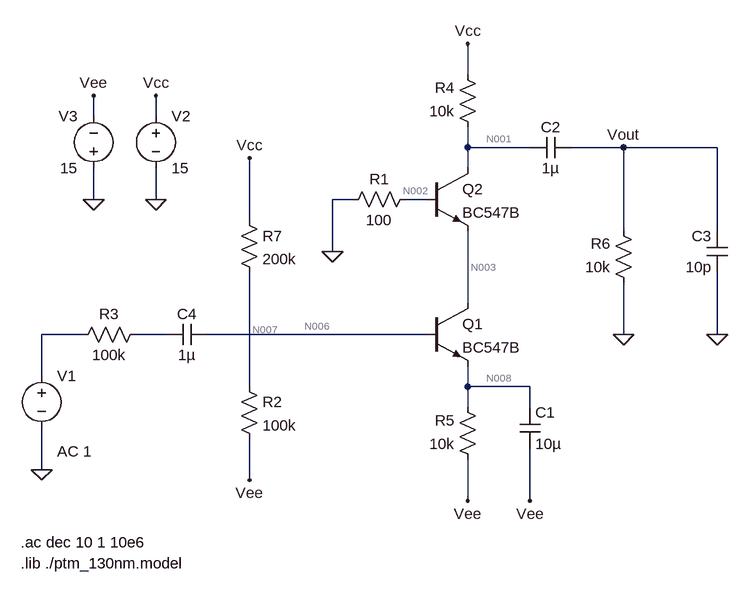
[diagram p0: schematic Draft2.asc]
Draft2.asc, the LTspice schematic file:
Version 4
SHEET 1 1020 680
WIRE 464 -224 464 -272
WIRE -112 -160 -112 -192
WIRE -16 -160 -16 -192
WIRE 464 -112 464 -144
WIRE 560 -112 464 -112
WIRE 704 -112 624 -112
WIRE 848 -112 704 -112
WIRE 464 -80 464 -112
WIRE -112 -32 -112 -80
WIRE -16 -32 -16 -80
WIRE 288 -32 256 -32
WIRE 400 -32 368 -32
WIRE 128 0 128 -96
WIRE 704 16 704 -112
WIRE 848 16 848 -112
WIRE 256 48 256 -32
WIRE 464 128 464 16
WIRE -128 176 -192 176
WIRE 0 176 -48 176
WIRE 400 176 64 176
WIRE 704 176 704 96
WIRE 848 176 848 80
WIRE -192 240 -192 176
WIRE 128 256 128 80
WIRE 464 256 464 224
WIRE 560 256 464 256
WIRE 464 288 464 256
WIRE 560 288 560 256
WIRE -192 384 -192 320
WIRE 128 400 128 336
WIRE 464 432 464 368
WIRE 560 432 560 352
FLAG 704 176 0
FLAG 848 176 0
FLAG 464 432 Vee
FLAG 560 432 Vee
FLAG 128 400 Vee
FLAG 464 -272 Vcc
FLAG -16 -32 0
FLAG -112 -32 0
FLAG -16 -192 Vcc
FLAG -112 -192 Vee
FLAG -192 384 0
FLAG 704 -112 Vout
FLAG 256 48 0
FLAG 128 -96 Vcc
SYMBOL res 384 -48 R90
WINDOW 0 0 56 VBottom 2
WINDOW 3 32 56 VTop 2
SYMATTR InstName R1
SYMATTR Value 100
SYMBOL res 112 240 R0
SYMATTR InstName R2
SYMATTR Value 100k
SYMBOL res -32 160 R90
WINDOW 0 0 56 VBottom 2
WINDOW 3 32 56 VTop 2
SYMATTR InstName R3
SYMATTR Value 100k
SYMBOL res 480 -128 R180
WINDOW 0 36 76 Left 2
WINDOW 3 36 40 Left 2
SYMATTR InstName R4
SYMATTR Value 10k
SYMBOL res 480 384 R180
WINDOW 0 36 76 Left 2
WINDOW 3 36 40 Left 2
SYMATTR InstName R5
SYMATTR Value 10k
SYMBOL res 720 112 R180
WINDOW 0 36 76 Left 2
WINDOW 3 36 40 Left 2
SYMATTR InstName R6
SYMATTR Value 10k
SYMBOL cap 544 288 R0
SYMATTR InstName C1
SYMATTR Value 10µ
SYMBOL cap 624 -128 R90
WINDOW 0 0 32 VBottom 2
WINDOW 3 32 32 VTop 2
SYMATTR InstName C2
SYMATTR Value 1µ
SYMBOL cap 864 80 R180
WINDOW 0 24 56 Left 2
WINDOW 3 24 8 Left 2
SYMATTR InstName C3
SYMATTR Value 10p
SYMBOL cap 0 192 R270
WINDOW 0 32 32 VTop 2
WINDOW 3 0 32 VBottom 2
SYMATTR InstName C4
SYMATTR Value 1µ
SYMBOL npn 400 128 R0
SYMATTR InstName Q1
SYMATTR Value BC547B
SYMBOL voltage -192 224 R0
WINDOW 123 24 132 Left 2
WINDOW 39 0 0 Left 0
SYMATTR Value2 AC 1
SYMATTR InstName V1
SYMATTR Value ""
SYMBOL voltage -16 -176 R0
WINDOW 123 0 0 Left 0
WINDOW 39 0 0 Left 0
SYMATTR InstName V2
SYMATTR Value 15
SYMBOL voltage -112 -64 R180
WINDOW 0 24 96 Left 2
WINDOW 3 24 16 Left 2
WINDOW 123 0 0 Left 0
WINDOW 39 0 0 Left 0
SYMATTR InstName V3
SYMATTR Value 15
SYMBOL npn 400 -80 R0
SYMATTR InstName Q2
SYMATTR Value BC547B
SYMBOL res 112 -16 R0
SYMATTR InstName R7
SYMATTR Value 200k
TEXT -224 496 Left 2 !.ac dec 10 1 10e6
TEXT -224 528 Left 2 !.lib ./ptm_130nm.model

The netlist it stands for:
* Draft2.asc
R1 N002 0 100
R2 N007 Vee 100k
R3 N005 N004 100k
R4 N001 Vcc 10k
R5 Vee N008 10k
R6 0 Vout 10k
C1 N008 Vee 10µ
C2 Vout N001 1µ
C3 0 Vout 10p
C4 N005 N006 1µ
Q1 N003 N006 N008 0 BC547B
V1 N004 0 AC 1
V2 Vcc 0 15
V3 0 Vee 15
Q2 N001 N002 N003 0 BC547B
R7 Vcc N007 200k
.model NPN NPN
.model PNP PNP
.lib standard.bjt
.ac dec 10 1 10e6
.lib ./ptm_130nm.model
.backanno
.end

* Results of the author's LTspice run, read from the files saved beside the schematic
* Operating Point, zero values left out:
*   V(n007) = -5 V
*   V(vee) = -15 V
*   V(n001) = 15 V
*   V(vcc) = 15 V
*   V(n008) = -15 V
*   V(n006) = -14.7 V
*   V(n003) = -298.8 mV
*   Ic(Q2) = 2.793 nA
*   Ie(Q2) = -2.792 nA
*   Ic(Q1) = 2.792 nA
*   Ie(Q1) = -2.792 nA
*   I(R7) = 100 µA
*   I(R5) = -2.792 nA
*   I(R4) = -2.793 nA
*   I(R2) = 100 µA
*   I(V3) = -100 µA
*   I(V2) = -100 µA
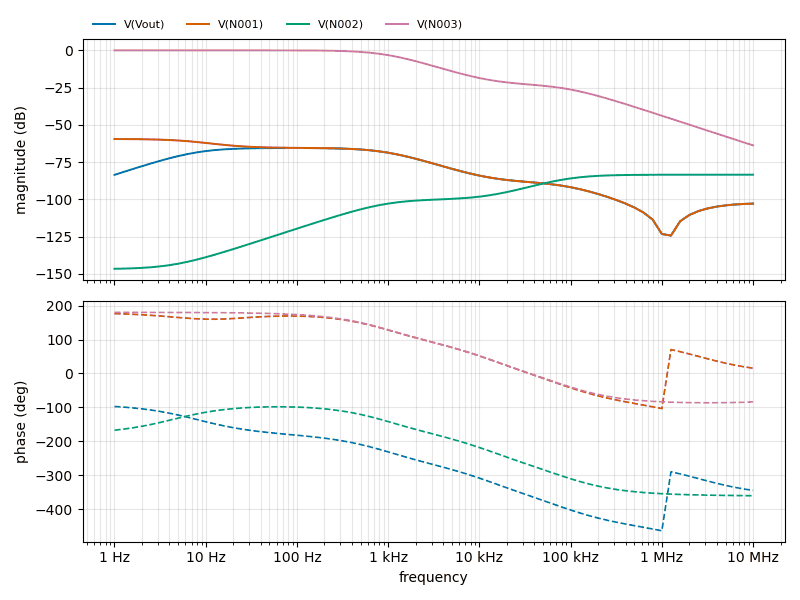
[diagram p1: AC Analysis of Draft2.asc, plotted from the saved traces]
* AC Analysis, 1 run:
*   V(Vout): -83.61 dB at 1 Hz, -102.87 dB at 10 MHz, peak -65.60 dB at 79.43 Hz, 3 dB below the peak at 7.838 Hz and 968.1 Hz
*   V(N001): -59.56 dB at 1 Hz, -102.87 dB at 10 MHz, peak -59.56 dB at 1 Hz, 3 dB below the peak at 11.48 Hz
*   V(N002): -146.64 dB at 1 Hz, -83.50 dB at 10 MHz, peak -83.50 dB at 6.31 MHz, 3 dB below the peak at 87.94 kHz
*   V(N003): -0.05 dB at 1 Hz, -63.82 dB at 10 MHz, peak -0.04 dB at 7.943 Hz, 3 dB below the peak at 950.8 Hz